# Altium schematic sheet Circuit_Schematic.SchDoc
size A
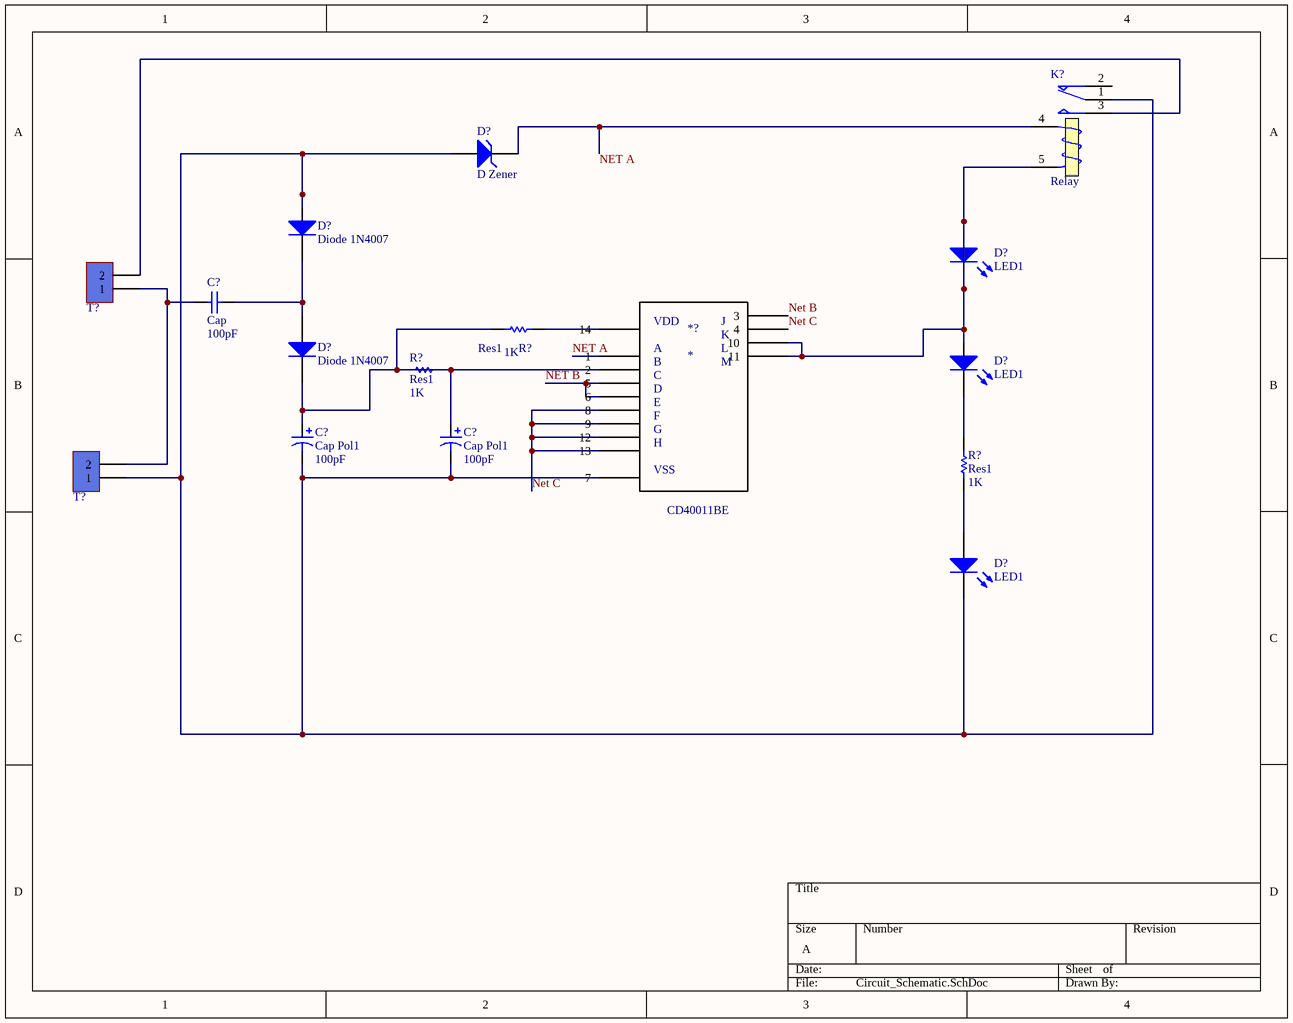
[diagram p0: Circuit_Schematic.SchDoc]

## Parts
(Parts that share a designator on the sheet are numbered #1, #2 ... from top to bottom, then left to right.)
*?  *  [CD4011BE]
C?#1  Cap  value 100pF  [RAD-0.3]
C?#2  Cap Pol1  value 100pF  [RB7.6-15]
C?#3  Cap Pol1  value 100pF  [RB7.6-15]
D?#1  D Zener  [DIODE-0.7]
D?#2  Diode 1N4007  [DO-41]
D?#3  LED1  [LED-1]
D?#4  Diode 1N4007  [DO-41]
D?#5  LED1  [LED-1]
D?#6  LED1  [LED-1]
K?  Relay  [MODULE5B]
R?#1  Res1  value 1K  [AXIAL-0.3]
R?#2  Res1  value 1K  [AXIAL-0.3]
R?#3  Res1  value 1K  [AXIAL-0.3]
T?#1  Terminal  [Terminal 1*2]  (value not drawn)
T?#2  Terminal  [Terminal 1*2]  (value not drawn)

## Nets
NET B: *?.?3(3)
Net C: *?.?4(4)
Net*?_?5: *?.?5(10) *?.?6(11) D?#3.1(A) D?#3.2(K) D?#5.1(A) K?.5(T2)
NetC?#1_1: C?#1.1 T?#1.1 T?#2.2
NetC?#1_2: C?#1.2 D?#2.2(K) D?#4.1(A)
NetC?#2_1: C?#2.1 C?#3.1 D?#4.2(K) R?#1.1 R?#2.1 R?#2.2
NetC?#2_2: C?#2.2 C?#3.2 D?#1.1(A) D?#2.1(A) D?#6.2(K) K?.1(COM) T?#2.1
NetD?#1_2: D?#1.2(K) K?.4(T1)
NetD?#5_2: D?#5.2(K) R?#3.1
NetD?#6_1: D?#6.1(A) R?#3.2
NetK?_3: K?.3(NO) T?#1.2

Not connected (* = marked no-connect by the designer): *? ?1(1) ?2(2) ?7(5) ?8(6) ?9(8) ?10(9) ?11(12) ?12(13) ?13(7) ?14(14); K? 2(NC); R?#1 2

## Notes on the sheet
- Labels drawn without touching a wire or pin: NET A
- (in symbol CD4011BE) VDD; J; K; A; L; B; M; C; D; E; F; G; H; VSS; CD40011BE

## Library data of the parts
*? = CD4011BE: Parameter 1: *
C?#1 = Cap: Capacitor; Published: 8-Jun-2000; LatestRevisionDate: 17-Jul-2002; LatestRevisionNote: Re-released for DXP Platform.; PackageReference: RAD-0.3; Publisher: Altium Limited; PackageDescription: Radial Cap, Thru-Hole; 2 Leads; 0.3 in Pin Spacing
C?#2 C?#3 = Cap Pol1: Polarized Capacitor (Radial); Published: 8-Jun-2000; LatestRevisionDate: 17-Jul-2002; LatestRevisionNote: Re-released for DXP Platform.; PackageReference: RB7.6-15; Publisher: Altium Limited; PackageDescription: Polarized Capacitor (Radial); 2 Leads
D?#1 = D Zener: Zener Diode; Published: 8-Jun-2000; LatestRevisionDate: 17-Jul-2002; LatestRevisionNote: Re-released for DXP Platform.; PackageReference: DIODE-0.7; Publisher: Altium Limited; PackageDescription: Diode, Thru-Hole; 2 Leads; 0.7 in Pin Spacing
D?#2 D?#4 = Diode 1N4007: 1 Amp General Purpose Rectifier; Published: 8-Jun-2000; LatestRevisionDate: 17-Jul-2002; LatestRevisionNote: Re-released for DXP Platform.; DatasheetVersion: 1998; PackageVersion: Aug-1999; PackageReference: DO-41; Publisher: Altium Limited; PackageDescription: Diode, Axial; Body 5.2 x 2.7 mm (LxDia. max), Lead Dia. 0.86 mm (max); Code_JEDEC: DO-204-AL; ComponentLink1Description: Manufacturer Link; ComponentLink1URL: http://www.fairchildsemi.com/; ComponentLink2Description: Datasheet; ComponentLink2URL: http://www.fairchildsemi.com/ds/1N%2F1N4001.pdf
D?#3 D?#5 D?#6 = LED1: Typical RED GaAs LED; Published: 8-Jun-2000; LatestRevisionDate: 08-Jul-2005; LatestRevisionNote: Mech Layer 1 removed.; PackageReference: LED-1; Publisher: Altium Limited; PackageDescription: LED; 2 Leads
K? = Relay: SPDT Relay; Published: 8-Jun-2000; LatestRevisionDate: 17-Jul-2002; LatestRevisionNote: Re-released for DXP Platform.; PackageReference: MODULE5B; Publisher: Altium Limited
R?#1-R?#3 = Res1: Resistor; Published: 8-Jun-2000; LatestRevisionDate: 17-Jul-2002; LatestRevisionNote: Re-released for DXP Platform.; PackageReference: AXIAL-0.3; Publisher: Altium Limited; PackageDescription: Axial Device, Thru-Hole; 2 Leads; 0.3 in Pin Spacing
T?#1 T?#2 = Terminal 1*2: Terminal 2 Pin 250VAC 16A; Designer: Seyed Mohsen Ghasemain; E-mail: picpars@gmail.com; ComponentLinkURL: www.picpars.com